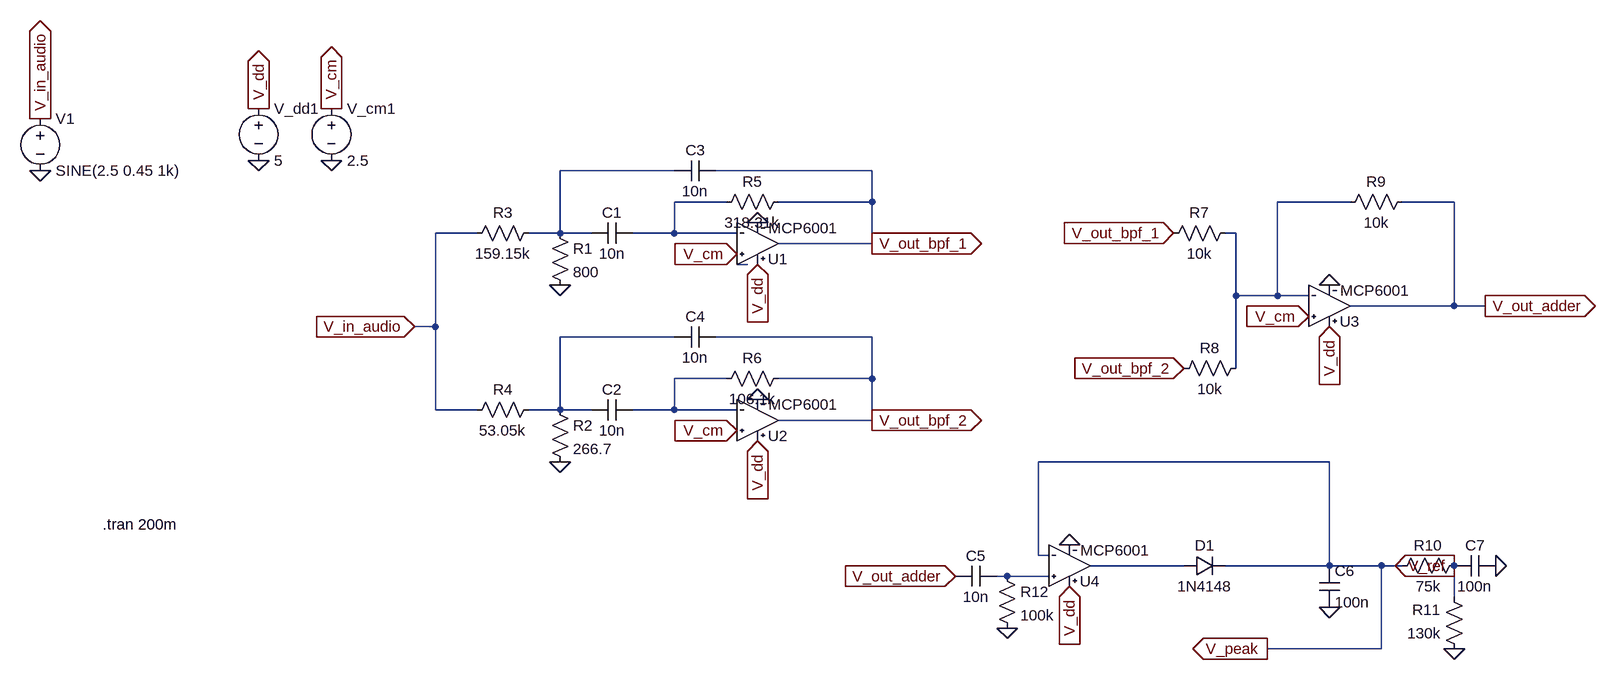
[diagram p0: schematic Exp7.asc]
Exp7.asc, the LTspice schematic file:
Version 4.1
SHEET 1 1728 792
WIRE 272 -16 96 -16
WIRE 576 -16 336 -16
WIRE 352 32 272 32
WIRE 576 32 576 -16
WIRE 576 32 432 32
WIRE 1312 32 1200 32
WIRE 1472 32 1392 32
WIRE -32 80 -96 80
WIRE 96 80 96 -16
WIRE 96 80 48 80
WIRE 144 80 96 80
WIRE 272 80 272 32
WIRE 272 80 208 80
WIRE 368 80 272 80
WIRE 1136 80 1120 80
WIRE 576 96 576 32
WIRE 576 96 432 96
WIRE 384 128 368 128
WIRE 1136 176 1136 80
WIRE 1200 176 1200 32
WIRE 1200 176 1136 176
WIRE 1248 176 1200 176
WIRE 1472 192 1472 32
WIRE 1472 192 1312 192
WIRE 1520 192 1472 192
WIRE -96 224 -96 80
WIRE -96 224 -128 224
WIRE 272 240 96 240
WIRE 576 240 336 240
WIRE 1136 288 1136 176
WIRE 352 304 272 304
WIRE 576 304 576 240
WIRE 576 304 432 304
WIRE -96 352 -96 224
WIRE -32 352 -96 352
WIRE 96 352 96 240
WIRE 96 352 48 352
WIRE 144 352 96 352
WIRE 272 352 272 304
WIRE 272 352 208 352
WIRE 368 352 272 352
WIRE 576 368 576 304
WIRE 576 368 432 368
WIRE 1280 432 832 432
WIRE 832 576 832 432
WIRE 848 576 832 576
WIRE 1056 592 912 592
WIRE 1280 592 1280 432
WIRE 1280 592 1120 592
WIRE 1360 592 1280 592
WIRE 1392 592 1360 592
WIRE 784 608 768 608
WIRE 848 608 784 608
WIRE 1472 640 1472 592
WIRE 1360 720 1360 592
WIRE 1360 720 1184 720
FLAG 368 384 V_cm
IOPIN 368 384 In
FLAG 368 112 V_cm
IOPIN 368 112 In
FLAG 576 96 V_out_bpf_1
IOPIN 576 96 Out
FLAG 576 368 V_out_bpf_2
IOPIN 576 368 Out
FLAG 96 160 0
FLAG 96 432 0
FLAG 400 64 0
FLAG 400 336 0
FLAG -128 224 V_in_audio
IOPIN -128 224 In
FLAG -368 -32 0
FLAG -256 -32 0
FLAG -256 -112 V_cm
IOPIN -256 -112 Out
FLAG -368 -112 V_dd
IOPIN -368 -112 Out
FLAG 400 128 V_dd
IOPIN 400 128 In
FLAG 400 400 V_dd
IOPIN 400 400 In
FLAG -704 -16 0
FLAG -704 -96 V_in_audio
IOPIN -704 -96 Out
FLAG 1040 80 V_out_bpf_1
IOPIN 1040 80 In
FLAG 1056 288 V_out_bpf_2
IOPIN 1056 288 In
FLAG 1280 224 V_dd
IOPIN 1280 224 In
FLAG 1248 208 V_cm
IOPIN 1248 208 In
FLAG 1280 160 0
FLAG 1520 192 V_out_adder
IOPIN 1520 192 Out
FLAG 704 608 V_out_adder
IOPIN 704 608 In
FLAG 880 560 0
FLAG 880 624 V_dd
IOPIN 880 624 In
FLAG 1280 656 0
FLAG 1472 720 0
FLAG 1536 592 0
FLAG 1472 592 V_ref
IOPIN 1472 592 Out
FLAG 1184 720 V_peak
IOPIN 1184 720 Out
FLAG 784 688 0
SYMBOL MCP6001 400 96 M180
SYMATTR InstName U1
SYMBOL MCP6001 400 368 M180
SYMATTR InstName U2
SYMBOL res 80 64 R0
SYMATTR InstName R1
SYMATTR Value 800
SYMBOL res 80 336 R0
SYMATTR InstName R2
SYMATTR Value 266.7
SYMBOL cap 208 64 R90
WINDOW 0 0 32 VBottom 2
WINDOW 3 32 32 VTop 2
SYMATTR InstName C1
SYMATTR Value 10n
SYMBOL cap 208 336 R90
WINDOW 0 0 32 VBottom 2
WINDOW 3 32 32 VTop 2
SYMATTR InstName C2
SYMATTR Value 10n
SYMBOL res 64 64 R90
WINDOW 0 0 56 VBottom 2
WINDOW 3 32 56 VTop 2
SYMATTR InstName R3
SYMATTR Value 159.15k
SYMBOL res 64 336 R90
WINDOW 0 0 56 VBottom 2
WINDOW 3 32 56 VTop 2
SYMATTR InstName R4
SYMATTR Value 53.05k
SYMBOL cap 336 -32 R90
WINDOW 0 0 32 VBottom 2
WINDOW 3 32 32 VTop 2
SYMATTR InstName C3
SYMATTR Value 10n
SYMBOL cap 336 224 R90
WINDOW 0 0 32 VBottom 2
WINDOW 3 32 32 VTop 2
SYMATTR InstName C4
SYMATTR Value 10n
SYMBOL res 448 16 R90
WINDOW 0 0 56 VBottom 2
WINDOW 3 32 56 VTop 2
SYMATTR InstName R5
SYMATTR Value 318.31k
SYMBOL res 448 288 R90
WINDOW 0 0 56 VBottom 2
WINDOW 3 32 56 VTop 2
SYMATTR InstName R6
SYMATTR Value 106.1k
SYMBOL voltage -368 -128 R0
SYMATTR InstName V_dd1
SYMATTR Value 5
SYMBOL voltage -256 -128 R0
SYMATTR InstName V_cm1
SYMATTR Value 2.5
SYMBOL voltage -704 -112 R0
WINDOW 123 0 0 Left 0
WINDOW 39 0 0 Left 0
SYMATTR InstName V1
SYMATTR Value SINE(2.5 0.45 1k)
SYMBOL res 1136 64 R90
WINDOW 0 0 56 VBottom 2
WINDOW 3 32 56 VTop 2
SYMATTR InstName R7
SYMATTR Value 10k
SYMBOL res 1152 272 R90
WINDOW 0 0 56 VBottom 2
WINDOW 3 32 56 VTop 2
SYMATTR InstName R8
SYMATTR Value 10k
SYMBOL MCP6001 1280 192 M180
SYMATTR InstName U3
SYMBOL res 1408 16 R90
WINDOW 0 0 56 VBottom 2
WINDOW 3 32 56 VTop 2
SYMATTR InstName R9
SYMATTR Value 10k
SYMBOL cap 768 592 R90
WINDOW 0 0 32 VBottom 2
WINDOW 3 32 32 VTop 2
SYMATTR InstName C5
SYMATTR Value 10n
SYMBOL MCP6001 880 592 M180
SYMATTR InstName U4
SYMBOL diode 1056 608 R270
WINDOW 0 32 32 VTop 2
WINDOW 3 0 32 VBottom 2
SYMATTR InstName D1
SYMATTR Value 1N4148
SYMBOL cap 1264 592 R0
SYMATTR InstName C6
SYMATTR Value 100n
SYMBOL res 1488 576 R90
WINDOW 0 0 56 VBottom 2
WINDOW 3 32 56 VTop 2
SYMATTR InstName R10
SYMATTR Value 75k
SYMBOL res 1488 736 R180
WINDOW 0 36 76 Left 2
WINDOW 3 36 40 Left 2
SYMATTR InstName R11
SYMATTR Value 130k
SYMBOL cap 1536 576 R90
WINDOW 0 0 32 VBottom 2
WINDOW 3 32 32 VTop 2
SYMATTR InstName C7
SYMATTR Value 100n
SYMBOL res 768 592 R0
SYMATTR InstName R12
SYMATTR Value 100k
TEXT -608 528 Left 2 !.tran 200m

The netlist it stands for:
* Exp7.asc
X§U1 V_cm N002 V_dd 0 V_out_bpf_1 MCP6001
X§U2 V_cm N006 V_dd 0 V_out_bpf_2 MCP6001
R1 N001 0 800
R2 N005 0 266.7
C1 N002 N001 10n
C2 N006 N005 10n
R3 N001 V_in_audio 159.15k
R4 N005 V_in_audio 53.05k
C3 V_out_bpf_1 N001 10n
C4 V_out_bpf_2 N005 10n
R5 V_out_bpf_1 N002 318.31k
R6 V_out_bpf_2 N006 106.1k
V_dd1 V_dd 0 5
V_cm1 V_cm 0 2.5
V1 V_in_audio 0 SINE(2.5 0.45 1k)
R7 N003 V_out_bpf_1 10k
R8 N003 V_out_bpf_2 10k
X§U3 V_cm N003 V_dd 0 V_out_adder MCP6001
R9 V_out_adder N003 10k
C5 N008 V_out_adder 10n
X§U4 N008 V_peak V_dd 0 N007 MCP6001
D1 N007 V_peak 1N4148
C6 V_peak 0 100n
R10 V_ref V_peak 75k
R11 0 V_ref 130k
C7 0 V_ref 100n
R12 N008 0 100k
.model D D
.lib standard.dio
.tran 200m
.lib ./MCP6001.lib
.backanno
.end